# EAGLE design Big VU meter - REV 5 (EAGLE 8.2.1)
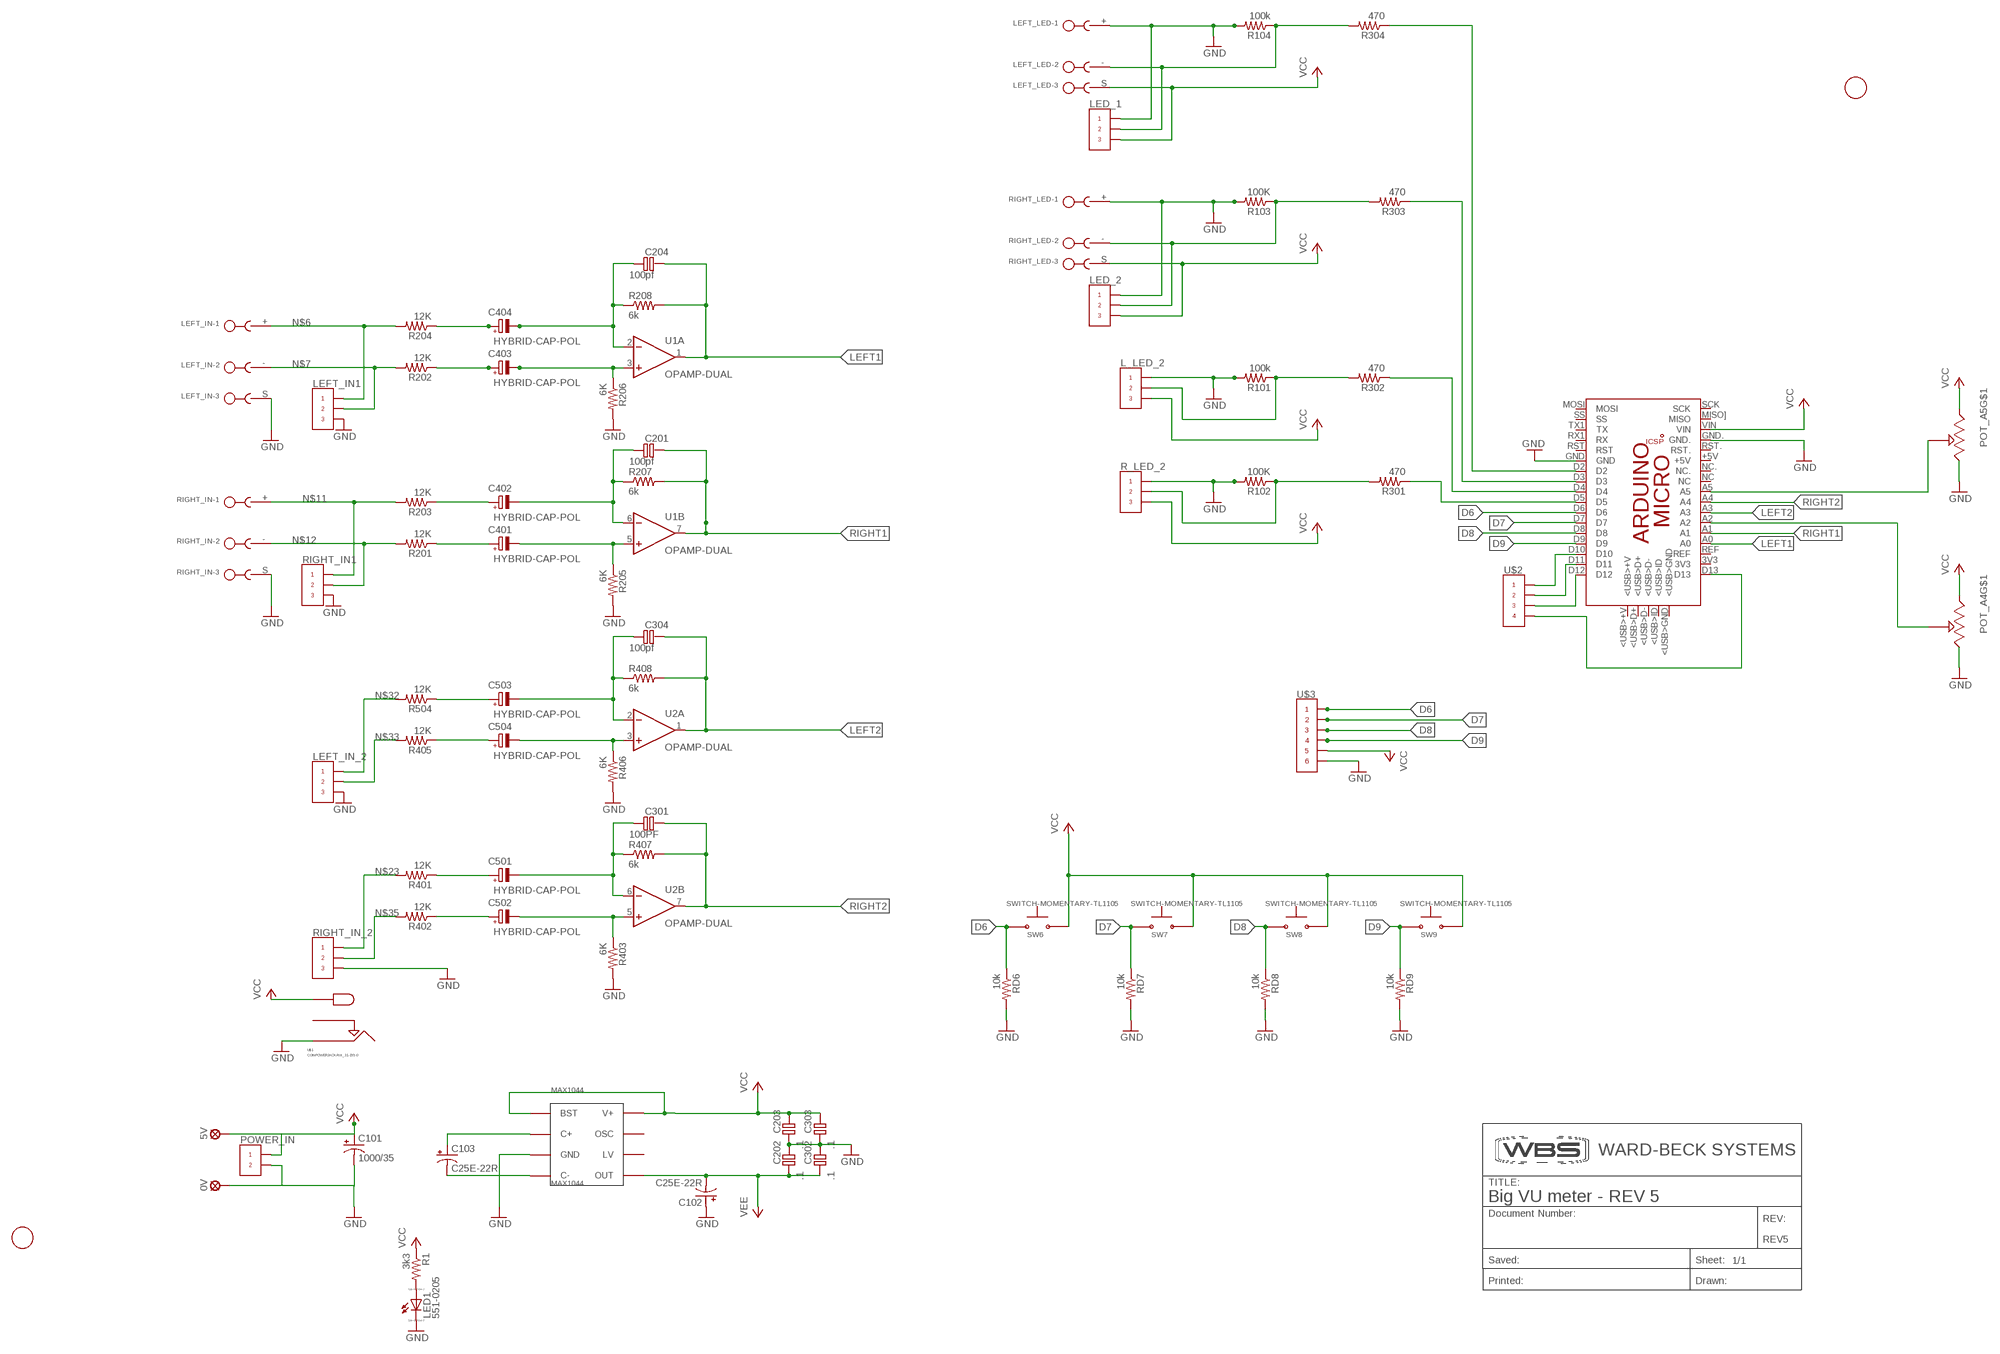
[diagram p0: schematic, sheet 1]

## Parts
0V  LSP13  [LSP13]
5V  LSP13  [LSP13]
C101  1000/35  CPOL-USE5-5  [E5-5]
C102  C25E-22R  CPOL-USE2.5-6  [E2,5-6]
C103  C25E-22R  CPOL-USE2.5-6  [E2,5-6]
C201  100pf  HYBRID-CERAMIC-1206-CAP  [HYBRID-CAP-CERAMIC-1206]
C202  .1  HYBRID-CERAMIC-1206-CAP  [HYBRID-CAP-CERAMIC-1206]
C203  .1  HYBRID-CERAMIC-1206-CAP  [HYBRID-CAP-CERAMIC-1206]
C204  100pf  HYBRID-CERAMIC-1206-CAP  [HYBRID-CAP-CERAMIC-1206]
C301  100PF  HYBRID-CERAMIC-1206-CAP  [HYBRID-CAP-CERAMIC-1206]
C302  .1  HYBRID-CERAMIC-1206-CAP  [HYBRID-CAP-CERAMIC-1206]
C303  .1  HYBRID-CERAMIC-1206-CAP  [HYBRID-CAP-CERAMIC-1206]
C304  100pf  HYBRID-CERAMIC-1206-CAP  [HYBRID-CAP-CERAMIC-1206]
C401  HYBRID-CAP-POL  [HYBRID-CAP-TANT]
C402  HYBRID-CAP-POL  [HYBRID-CAP-TANT]
C403  HYBRID-CAP-POL  [HYBRID-CAP-TANT]
C404  HYBRID-CAP-POL  [HYBRID-CAP-TANT]
C501  HYBRID-CAP-POL  [HYBRID-CAP-TANT]
C502  HYBRID-CAP-POL  [HYBRID-CAP-TANT]
C503  HYBRID-CAP-POL  [HYBRID-CAP-TANT]
C504  HYBRID-CAP-POL  [HYBRID-CAP-TANT]
L_LED_2  CON-WBS-LOCKING-0.1-3  [CON-WBS-LOCKING-0.1-3]
LED1  551-0205  LED_ELD260  [LED_LD260]
LED_1  CON-WBS-LOCKING-0.1-3  [CON-WBS-LOCKING-0.1-3]
LED_2  CON-WBS-LOCKING-0.1-3  [CON-WBS-LOCKING-0.1-3]
LEFT_IN  CON-PHOENIX_RIGHT_ANGLE_3.81  [CON-PHOENIX_MC1.5/3-G-3.81]
LEFT_IN1  CON-WBS-LOCKING-0.1-3  [CON-WBS-LOCKING-0.1-3]
LEFT_IN_2  CON-WBS-LOCKING-0.1-3  [CON-WBS-LOCKING-0.1-3]
LEFT_LED  CON-PHOENIX_RIGHT_ANGLE_3.81  [CON-PHOENIX_MC1.5/3-G-3.81]
MAX1044  MAX1044  [DIP8]
PCB1  ARDUINO_MICRO  [ARDUINO_MICRO]
POT_A4  10-080  WBS_10-079_POT  [WBS_079]
POT_A5  10-080  WBS_10-079_POT  [WBS_079]
POWER_IN  CON-WBS-LOCKING-0.1-2  [CON-WBS-LOCKING-0.1-2]
R1  3k3  HYBRID-RESITOR-1206-0.3  [HYBRID-RESISTOR-1206-0.3]
R101  100k  HYBRID-RESITOR-1206-0.3  [HYBRID-RESISTOR-1206-0.3]
R102  100K  HYBRID-RESITOR-1206-0.3  [HYBRID-RESISTOR-1206-0.3]
R103  100K  HYBRID-RESITOR-1206-0.3  [HYBRID-RESISTOR-1206-0.3]
R104  100k  HYBRID-RESITOR-1206-0.3  [HYBRID-RESISTOR-1206-0.3]
R201  12K  HYBRID-RESITOR-1206-0.3  [HYBRID-RESISTOR-1206-0.3]
R202  12K  HYBRID-RESITOR-1206-0.3  [HYBRID-RESISTOR-1206-0.3]
R203  12K  HYBRID-RESITOR-1206-0.3  [HYBRID-RESISTOR-1206-0.3]
R204  12K  HYBRID-RESITOR-1206-0.3  [HYBRID-RESISTOR-1206-0.3]
R205  6K  HYBRID-RESITOR-1206-0.3  [HYBRID-RESISTOR-1206-0.3]
R206  6K  HYBRID-RESITOR-1206-0.3  [HYBRID-RESISTOR-1206-0.3]
R207  6k  HYBRID-RESITOR-1206-0.3  [HYBRID-RESISTOR-1206-0.3]
R208  6k  HYBRID-RESITOR-1206-0.3  [HYBRID-RESISTOR-1206-0.3]
R301  470  HYBRID-RESITOR-1206-0.3  [HYBRID-RESISTOR-1206-0.3]
R302  470  HYBRID-RESITOR-1206-0.3  [HYBRID-RESISTOR-1206-0.3]
R303  470  HYBRID-RESITOR-1206-0.3  [HYBRID-RESISTOR-1206-0.3]
R304  470  HYBRID-RESITOR-1206-0.3  [HYBRID-RESISTOR-1206-0.3]
R401  12K  HYBRID-RESITOR-1206-0.3  [HYBRID-RESISTOR-1206-0.3]
R402  12K  HYBRID-RESITOR-1206-0.3  [HYBRID-RESISTOR-1206-0.3]
R403  6K  HYBRID-RESITOR-1206-0.3  [HYBRID-RESISTOR-1206-0.3]
R405  12K  HYBRID-RESITOR-1206-0.3  [HYBRID-RESISTOR-1206-0.3]
R406  6K  HYBRID-RESITOR-1206-0.3  [HYBRID-RESISTOR-1206-0.3]
R407  6k  HYBRID-RESITOR-1206-0.3  [HYBRID-RESISTOR-1206-0.3]
R408  6k  HYBRID-RESITOR-1206-0.3  [HYBRID-RESISTOR-1206-0.3]
R504  12K  HYBRID-RESITOR-1206-0.3  [HYBRID-RESISTOR-1206-0.3]
R_LED_2  CON-WBS-LOCKING-0.1-3  [CON-WBS-LOCKING-0.1-3]
RD6  10k  HYBRID-RESITOR-1206-0.3  [HYBRID-RESISTOR-1206-0.3]
RD7  10k  HYBRID-RESITOR-1206-0.3  [HYBRID-RESISTOR-1206-0.3]
RD8  10k  HYBRID-RESITOR-1206-0.3  [HYBRID-RESISTOR-1206-0.3]
RD9  10k  HYBRID-RESITOR-1206-0.3  [HYBRID-RESISTOR-1206-0.3]
REV5  WBS-DOCUMENT_INFO_FRAME  [WBS-FRAME_PCB]
RIGHT_IN  CON-PHOENIX_RIGHT_ANGLE_3.81  [CON-PHOENIX_MC1.5/3-G-3.81]
RIGHT_IN1  CON-WBS-LOCKING-0.1-3  [CON-WBS-LOCKING-0.1-3]
RIGHT_IN_2  CON-WBS-LOCKING-0.1-3  [CON-WBS-LOCKING-0.1-3]
RIGHT_LED  CON-PHOENIX_RIGHT_ANGLE_3.81  [CON-PHOENIX_MC1.5/3-G-3.81]
SW6  SWITCH-MOMENTARY-TL1105  [SWITCH-TACT_TL1105]
SW7  SWITCH-MOMENTARY-TL1105  [SWITCH-TACT_TL1105]
SW8  SWITCH-MOMENTARY-TL1105  [SWITCH-TACT_TL1105]
SW9  SWITCH-MOMENTARY-TL1105  [SWITCH-TACT_TL1105]
U1  OPAMP-DUAL  [DIP8]
U2  OPAMP-DUAL  [DIP8]
U$1  CON-POWERJACK-R/A_31-155-0  [CON-POWERJACK-R/A_31-155-0]
U$2  CON-WBS-LOCKING-0.1-4  [CON-WBS-LOCKING-0.1-4]
U$3  CON-WBS-LOCKING-0.1-6  [CON-WBS-LOCKING-0.1-6]
U$4  FIDUCIAL  [FIDUCIAL_1MM]
U$5  FIDUCIAL  [FIDUCIAL_1MM]

## Nets
D6: PCB1.D6 RD6.1 RD6.1A SW6.P$1 SW6.P$2 U$3.P$1
D7: PCB1.D7 RD7.1 RD7.1A SW7.P$1 SW7.P$2 U$3.P$2
D8: PCB1.D8 RD8.1 RD8.1A SW8.P$1 SW8.P$2 U$3.P$3
D9: PCB1.D9 RD9.1 RD9.1A SW9.P$1 SW9.P$2 U$3.P$4
D10: PCB1.D10 U$2.P$1
D11: PCB1.D11 U$2.P$2
D12: PCB1.D12 U$2.P$3
D13: PCB1.D13 U$2.P$4
GND: 0V.MP C101.- C102.+ C202.2(-) C202.B2(-) C203.1(+) C203.A1(+) C302.2(-) C302.B2(-) C303.1(+) C303.A1(+) L_LED_2.P$1 LED1.K(C) LED_1.P$1 LED_2.P$1 LEFT_IN1.P$3 LEFT_IN.S LEFT_IN_2.P$3 LEFT_LED.+ MAX1044.P$3(GND) PCB1.GND PCB1.GND. POT_A4.P$3(CW) POT_A5.P$3(CW) POWER_IN.P$2 R101.2 R101.2A R102.2 R102.2A R103.2 R103.2A R104.2 R104.2A R205.2 R205.2A R206.2 R206.2A R403.2 R403.2A R406.2 R406.2A R_LED_2.P$1 RD6.2 RD6.2A RD7.2 RD7.2A RD8.2 RD8.2A RD9.2 RD9.2A RIGHT_IN1.P$3 RIGHT_IN.S RIGHT_IN_2.P$3 RIGHT_LED.+ U$1.SLEEVE U$3.P$6
LEFT1: C204.2(-) C204.B2(-) PCB1.A0 R208.2 R208.2A U1.1(A:OUT)
LEFT2: C304.2(-) C304.B2(-) PCB1.A3 R408.2 R408.2A U2.1(A:OUT)
N$1 [POWER]: C103.+ MAX1044.P$2(C+)
N$2 [POWER]: C103.- MAX1044.P$4(C-)
N$3: C204.1(+) C204.A1(+) C404.- C404.-VE(-) R208.1 R208.1A U1.2(A:IN-)
N$4: C403.- C403.-VE(-) R206.1 R206.1A U1.3(A:IN+)
N$5: PCB1.A5 POT_A5.P$2(WIPER)
N$6: LEFT_IN1.P$1 LEFT_IN.+ R204.2 R204.2A
N$7: LEFT_IN1.P$2 LEFT_IN.- R202.2 R202.2A
N$8: C201.1(+) C201.A1(+) C402.- C402.-VE(-) R207.1 R207.1A U1.6(B:IN-)
N$9: C401.- C401.-VE(-) R205.1 R205.1A U1.5(B:IN+)
N$10: PCB1.D3 R303.1 R303.1A
N$11: R203.2 R203.2A RIGHT_IN1.P$1 RIGHT_IN.+
N$12: R201.2 R201.2A RIGHT_IN1.P$2 RIGHT_IN.-
N$13: PCB1.D2 R304.1 R304.1A
N$14 [POWER]: LED_2.P$2 R103.1 R103.1A R303.2 R303.2A RIGHT_LED.-
N$15 [POWER]: LED_1.P$2 LEFT_LED.- R104.1 R104.1A R304.2 R304.2A
N$16: PCB1.A2 POT_A4.P$2(WIPER)
N$17: C304.1(+) C304.A1(+) C503.- C503.-VE(-) R408.1 R408.1A U2.2(A:IN-)
N$18: C504.- C504.-VE(-) R406.1 R406.1A U2.3(A:IN+)
N$19: LED1.A R1.2 R1.2A
N$20: R102.1 R102.1A R301.2 R301.2A R_LED_2.P$2
N$21: C301.1(+) C301.A1(+) C501.- C501.-VE(-) R407.1 R407.1A U2.6(B:IN-)
N$22: C502.- C502.-VE(-) R403.1 R403.1A U2.5(B:IN+)
N$23: R401.2 R401.2A RIGHT_IN_2.P$1
N$24: L_LED_2.P$2 R101.1 R101.1A R302.2 R302.2A
N$25: PCB1.D4 R302.1 R302.1A
N$26: PCB1.D5 R301.1 R301.1A
N$27: C501.+ C501.+VE(+) R401.1 R401.1A
N$28: C502.+ C502.+VE(+) R402.1 R402.1A
N$29: C503.+ C503.+VE(+) R504.1 R504.1A
N$30: C504.+ C504.+VE(+) R405.1 R405.1A
N$31: C401.+ C401.+VE(+) R201.1 R201.1A
N$32: LEFT_IN_2.P$1 R504.2 R504.2A
N$33: LEFT_IN_2.P$2 R405.2 R405.2A
N$34: C402.+ C402.+VE(+) R203.1 R203.1A
N$35: R402.2 R402.2A RIGHT_IN_2.P$2
N$36: C404.+ C404.+VE(+) R204.1 R204.1A
N$37: C403.+ C403.+VE(+) R202.1 R202.1A
RIGHT1: C201.2(-) C201.B2(-) PCB1.A1 R207.2 R207.2A U1.7(B:OUT)
RIGHT2: C301.2(-) C301.B2(-) PCB1.A4 R407.2 R407.2A U2.7(B:OUT)
VCC [POWER]: 5V.MP C101.+ C203.2(-) C203.B2(-) C303.2(-) C303.B2(-) L_LED_2.P$3 LED_1.P$3 LED_2.P$3 LEFT_LED.S MAX1044.P$1(BST) MAX1044.P$8(V+) PCB1.VIN POT_A4.P$1(CCW) POT_A5.P$1(CCW) POWER_IN.P$1 R1.1 R1.1A R_LED_2.P$3 RIGHT_LED.S SW6.P$3 SW6.P$4 SW7.P$3 SW7.P$4 SW8.P$3 SW8.P$4 SW9.P$3 SW9.P$4 U$1.TIP U$3.P$5
VEE [POWER]: C102.- C202.1(+) C202.A1(+) C302.1(+) C302.A1(+) MAX1044.P$5(OUT)
Unconnected: MAX1044.P$6(LV) MAX1044.P$7(OSC) PCB1.3V3 PCB1.5V PCB1.+5V PCB1.<USB>+V PCB1.<USB>D+ PCB1.<USB>D- PCB1.<USB>GND PCB1.<USB>ID PCB1.GND_ PCB1.MISO. PCB1.MISO](MISO) PCB1.MOSI PCB1.MOSI. PCB1.NC PCB1.NC. PCB1.REF PCB1.RESET.. PCB1.RST PCB1.RST. PCB1.RX1(RX) PCB1.SCK PCB1.SCK. PCB1.SS PCB1.TX1(TX) POT_A4.P$4(CCW) POT_A4.P$5(WIPER) POT_A4.P$6(CW) POT_A5.P$4(CCW) POT_A5.P$5(WIPER) POT_A5.P$6(CW) U$1.CONTACT(NORM)

## Power pins joined to a net without a drawn wire
VCC: U1.8(SUP:VCC) U2.8(SUP:VCC)
VEE: U1.4(SUP:VEE) U2.4(SUP:VEE)

## Library data of the parts
0V 5V = solpad:LSP13: SOLDER PAD drill 1.3 mm, distributor Buerklin, 12H562
C101-C103 = rcl:CPOL-US: POLARIZED CAPACITOR, American symbol
C201-C204 C301-C304 = APK - PARTS:HYBRID-CERAMIC-1206-CAP
C401-C404 C501-C504 = APK - PARTS:HYBRID-CAP-POL
L_LED_2 LED_1 LED_2 LEFT_IN1 LEFT_IN_2 R_LED_2 RIGHT_IN1 RIGHT_IN_2 = APK - PARTS:CON-WBS-LOCKING-0.1-3
LED1 = eagle-ltspice:LED_E: LED Source: http://www.osram.convergy.de Source: www.luxeon.com Source: www.kingbright.com; SPICEMODEL: NONE; SPICEPREFIX: D; SPICETYPE: diode
LEFT_IN LEFT_LED RIGHT_IN RIGHT_LED = APK - PARTS:CON-PHOENIX_RIGHT_ANGLE_3.81
MAX1044 = APK - PARTS:MAX1044
PCB1 = E14_Arduino_revB:ARDUINO_MICRO: Device for representing an Arduino Micro board with a footprint in an EAGLE design. Created by Dave Young for Element14. More EAGLE documentation at: http://www.element14.com/community/community/knode/cadsoft_eagle
POT_A4 POT_A5 = APK - PARTS:WBS_10-079_POT
POWER_IN = APK - PARTS:CON-WBS-LOCKING-0.1-2
R1 R101-R104 R201-R208 R301-R304 R401-R403 R405-R408 R504 RD6-RD9 = APK - PARTS:HYBRID-RESITOR-1206-0.3
REV5 = APK - PARTS:WBS-DOCUMENT_INFO_FRAME
SW6-SW9 = APK - PARTS:SWITCH-MOMENTARY-TL1105
U1 U2 = Op Amps:OPAMP-DUAL: Operational amplifier, dual; SPICE: X{NAME}A {A.IN+.NET} {A.IN-.NET} {VCC.NET} {VEE.NET} {A.OUT.NET} OPAMP\nX{NAME}B {B.IN+.NET} {B.IN-.NET} {VCC.NET} {VEE.NET} {B.OUT.NET} OPAMP; SPICEMOD: .SUBCKT OPAMP 1 2 101 102 81\n.model NPN NPN(BF=50000)\nQ1 5 1 7 NPN\nQ2 6 2 8 NPN\nRC1 101 5 95.49\nRC2 101 6 95.49\nRE1 7 4 43.79\nRE2 8 4 43.79\nI1 4 102 0.001\nG1 100 10 6 5 0.0104719\nRP1 10 100 9.549MEG\nCP1 10 100 0.0016667UF\nEOUT 80 100 10 100 1\nRO 80 81 100\nRREF1 101 103 100K\nRREF2 103 102 100K\nEREF 100 0 103 0 1\nR100 100 0 1MEG\n.ENDS
U$1 = APK - PARTS:CON-POWERJACK-R/A_31-155-0
U$2 = APK - PARTS:CON-WBS-LOCKING-0.1-4
U$3 = APK - PARTS:CON-WBS-LOCKING-0.1-6
U$4 U$5 = adafruit:FIDUCIAL: For use by pick and place machines to calibrate the vision/machine, 1mm By microbuilder.eu

## Net classes
0 default: width 0.305 mm
1 POWER: width 0.508 mm
2 UNBALANCED AUDIO: width 0.635 mm, drill 0.254 mm

## Board
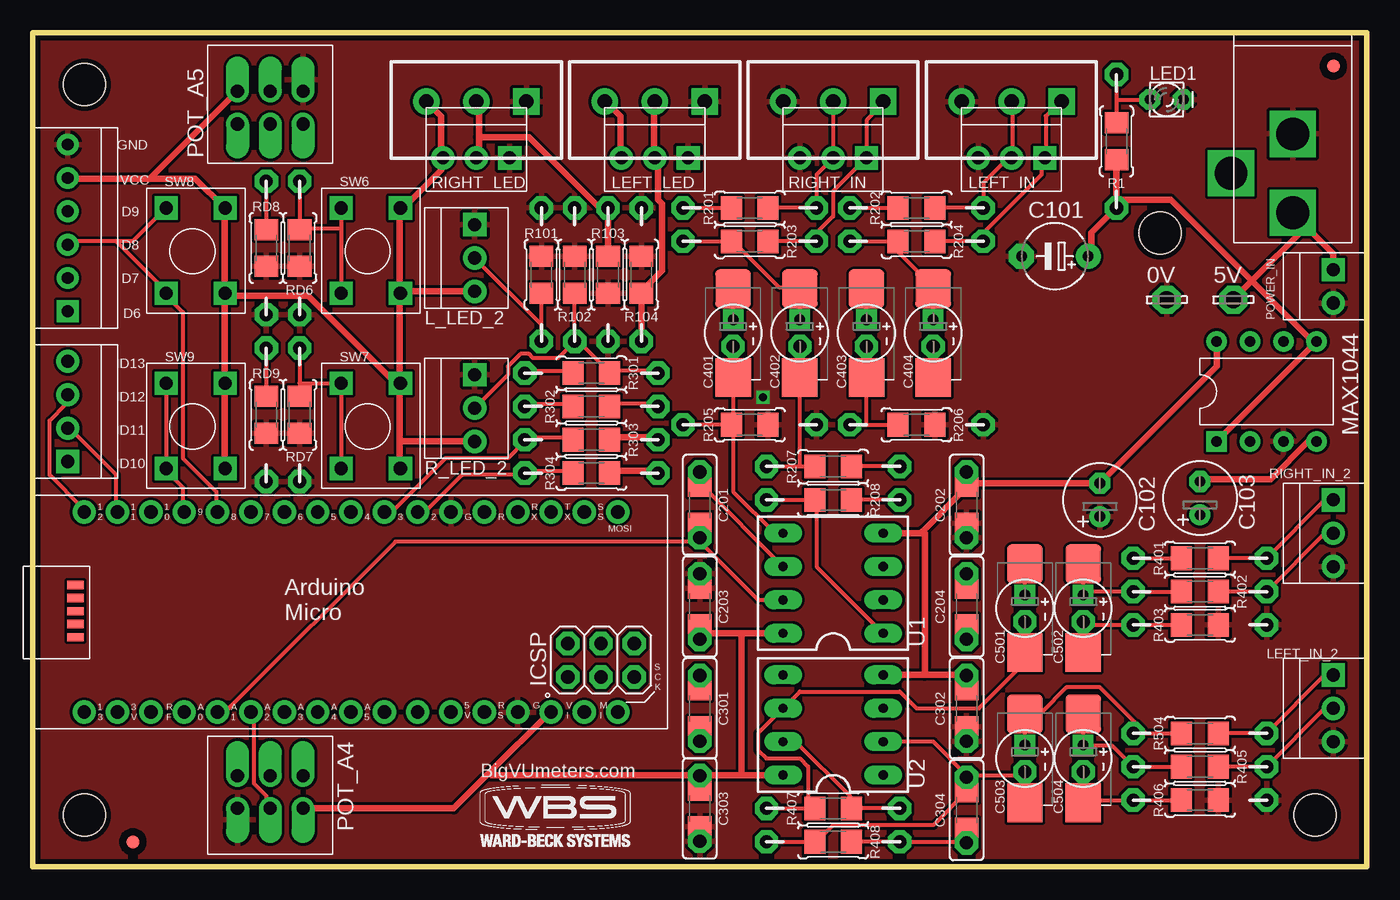
[diagram p1: board, top side]
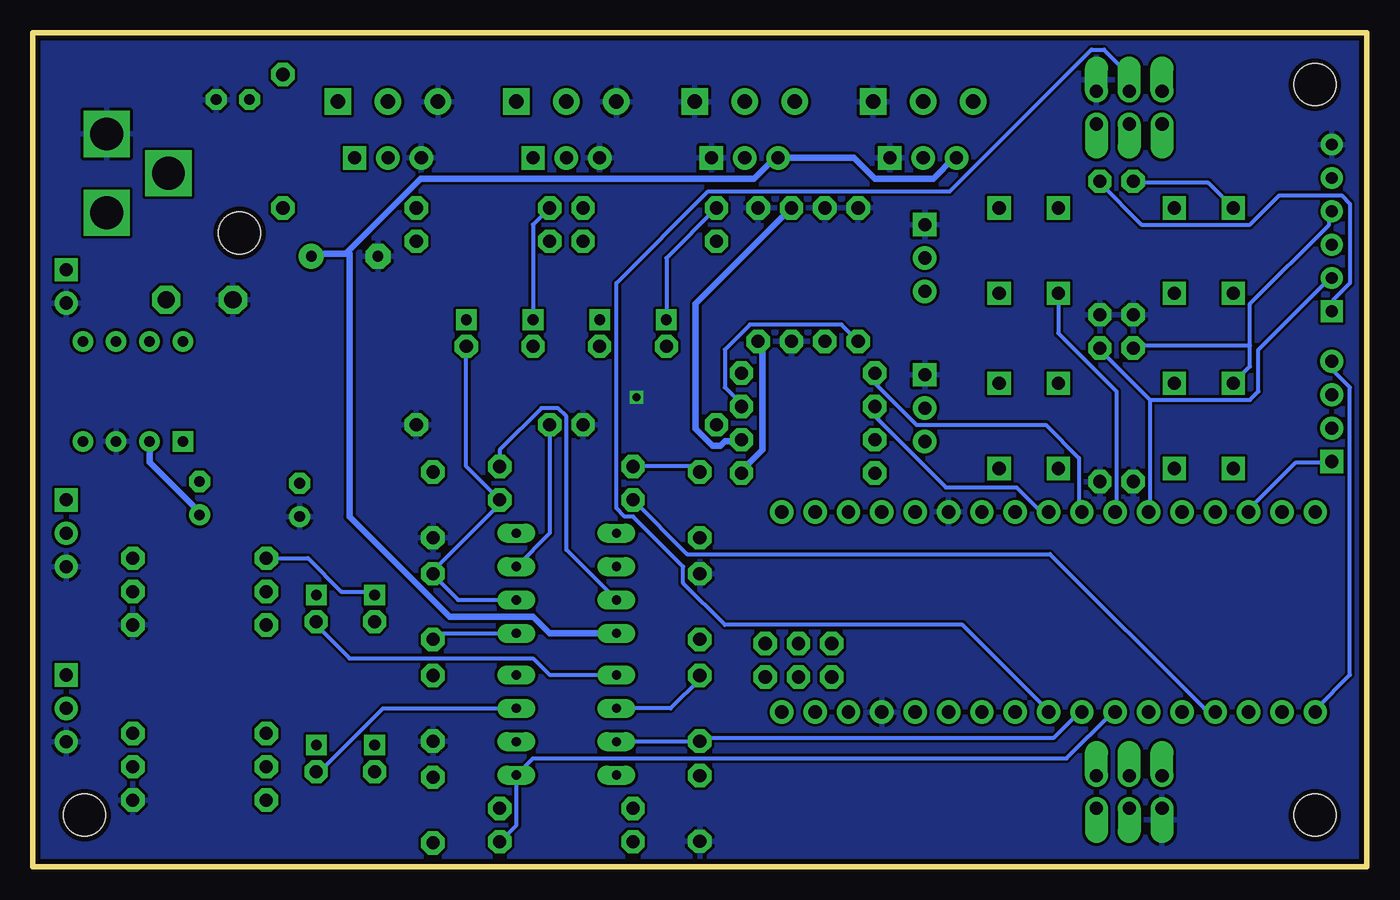
[diagram p2: board, bottom side, seen from below]

Size 101.6 x 63.5 mm. Coordinates in mm from the lower left corner, seen from the top.
Outline: 0,63.5 101.6,63.5 101.6,0 0,0 0,63.5
Copper layers (1*16): Top 0.035mm / dielectric 1.5mm / Bottom 0.035mm
Design rules "Starting Point *": minimum track width 10mil, minimum drill 24mil, track to track 8mil, track to pad 8mil, pad to pad 8mil, via to via 8mil, smd to smd 8mil, copper to edge 15mil, drill to drill 8mil, minimum pad ring 15mil, minimum via ring 8mil, stop-mask expansion 4mil, vias tented up to drill 0mil, thermal gap 10mil
Holes 3.2 mm at 3.94,59.56 3.94,3.94 97.66,3.94 85.85,48.26

### Footprints (pad centres in the part's own frame; a part is rotated, then mirrored left to right if it is on the bottom)
LSP13 = drill 1.321 pad 2.159 octagon: MP 0,0
E5-5 = drill 0.813 pad 1.905: + -2.54,0 | drill 0.813 pad 1.905 octagon: - 2.54,0
E2,5-6 = drill 0.813 pad 1.6: + -1.27,0 | drill 0.813 pad 1.6 octagon: - 1.27,0
HYBRID-CAP-CERAMIC-1206 = smd 1.6 x 1.8: 1 -1.4,0; 2 1.4,0 | drill 1 pad 1.778 octagon: A1 -2.5,0; B2 2.5,0
HYBRID-CAP-TANT = smd 2.95 x 2.7: + 3.375,0; - -3.375,0 | drill 0.813 pad 1.524 square: +VE 1.016,0 | drill 1 pad 1.524 octagon: -VE -1.016,0
CON-WBS-LOCKING-0.1-3 = drill 1 pad 1.778 square: P$1 2.54,0 | drill 1 pad 1.778: P$2 0,0; P$3 -2.54,0
LED_LD260 = drill 0.813 octagon: A -1.27,0; K 1.27,0
CON-PHOENIX_MC1.5/3-G-3.81 = drill 1.1 pad 2.032 square: + 3.81,0 | drill 1.1 pad 2.032: - 0,0; S -3.81,0
DIP8 = drill 0.8 square: P$1 -3.81,3.81 | drill 0.8: P$2 -3.81,1.27; P$3 -3.81,-1.27; P$4 -3.81,-3.81; P$5 3.81,3.81; P$6 3.81,1.27; P$7 3.81,-1.27; P$8 3.81,-3.81
ARDUINO_MICRO = drill 1.016 pad 1.575: 3V3 6.35,1.27; +5V 31.75,1.27; A0 11.43,1.27; A1 13.97,1.27; A2 16.51,1.27; A3 19.05,1.27; A4 21.59,1.27; A5 24.13,1.27; D2 29.21,16.51; D3 26.67,16.51; D4 24.13,16.51; D5 21.59,16.51; D6 19.05,16.51; D7 16.51,16.51; D8 13.97,16.51; D9 11.43,16.51; D10 8.89,16.51; D11 6.35,16.51; D12 3.81,16.51; D13 3.81,1.27; GND 31.75,16.51; GND. 36.83,1.27; MISO] 41.91,1.27; MOSI 44.45,16.51; NC 26.67,1.27; NC. 29.21,1.27; REF 8.89,1.27; RST 34.29,16.51; RST. 34.29,1.27; RX1 36.83,16.51; SCK 44.45,1.27; SS 41.91,16.51; TX1 39.37,16.51; VIN 39.37,1.27 | drill 1.016 pad 1.575 octagon: 5V 40.64,6.477; GND_ 45.72,6.477; MISO. 40.64,3.937; MOSI. 43.18,6.477; RESET.. 45.72,3.937; SCK. 43.18,3.937 | smd 1.27 x 0.635: <USB>+V 3.15,10.947; <USB>D+ 3.15,9.957; <USB>D- 3.15,8.941; <USB>GND 3.15,6.96; <USB>ID 3.15,7.976
WBS_079 = drill 1 offset: P$1 0,2.5; P$2 0,0; P$3 0,-2.5; P$4 -2.5,2.5; P$5 -2.5,0; P$6 -2.5,-2.5
CON-WBS-LOCKING-0.1-2 = drill 1 square: P$1 2.54,0 | drill 1: P$2 0,0
HYBRID-RESISTOR-1206-0.3 = smd 1.6 x 1.8: 1 -1.4,0; 2 1.4,0 | drill 1 pad 1.778 octagon: 1A -5.08,0; 2A 5.08,0
SWITCH-TACT_TL1105 = drill 1 square: P$1 -3.175,-1.905; P$2 3.325,-1.905; P$3 -3.175,2.595; P$4 3.325,2.595
DIP8' = drill 0.7 long: 1 0,2.54; 2 0,0; 3 0,-2.54; 4 0,-5.08; 5 7.62,-5.08; 6 7.62,-2.54; 7 7.62,0; 8 7.62,2.54
CON-POWERJACK-R/A_31-155-0 = drill 2.5 square: CONTACT 10.7,-4.7; SLEEVE 7.7,0; TIP 13.7,0
CON-WBS-LOCKING-0.1-4 = drill 1 square: P$1 5.08,0 | drill 1: P$2 2.54,0; P$3 0,0; P$4 -2.54,0
CON-WBS-LOCKING-0.1-6 = drill 0.9 square: P$1 6.35,0 | drill 0.9: P$2 3.81,0; P$3 1.27,0; P$4 -1.27,0; P$5 -3.81,0; P$6 -6.35,0
FIDUCIAL_1MM = smd 1 x 1: 1 0,0

### Placement (x,y rotation side)
0V  86.36,43.18 0 top
5V  91.44,43.18 0 top
C101  77.85,46.48 180 top
C102  81.28,27.94 90 top
C103  88.9,28.07 90 top
C201  50.8,27.56 270 top
C202  71.12,27.56 270 top
C203  50.8,19.81 270 top
C204  71.12,19.81 270 top
C301  50.8,12.06 270 top
C302  71.12,12.06 270 top
C303  50.8,4.45 90 top
C304  71.12,4.32 270 top
C401  53.34,40.64 90 top
C402  58.42,40.64 90 top
C403  63.5,40.64 90 top
C404  68.58,40.64 90 top
C501  75.56,19.69 90 top
C502  80.01,19.69 90 top
C503  75.56,8.26 90 top
C504  80.01,8.26 90 top
L_LED_2  33.66,46.36 90 top
LED1  86.36,58.42 0 top
LED_1  47.37,53.98 0 top
LED_2  33.78,53.98 0 top
LEFT_IN  74.55,58.27 0 top
LEFT_IN1  74.55,53.98 0 top
LEFT_IN_2  99.06,12.06 90 top
LEFT_LED  47.37,58.27 0 top
MAX1044  93.98,36.2 90 top
PCB1  0.1,10.52 0 top
POT_A4  18.08,4.45 270 top
POT_A5  18.08,59.05 90 top
POWER_IN  99.06,42.93 90 top
R1  82.55,55.24 90 top
R101  38.73,45.09 90 top
R102  41.27,45.09 90 top
R103  43.81,45.09 270 top
R104  46.35,45.09 90 top
R201  54.61,50.16 0 top
R202  67.31,50.16 0 top
R203  54.61,47.62 0 top
R204  67.31,47.62 0 top
R205  54.61,33.66 0 top
R206  67.31,33.66 0 top
R207  60.96,30.48 0 top
R208  60.96,27.94 180 top
R301  42.55,37.59 0 top
R302  42.55,35.05 0 top
R303  42.55,32.51 0 top
R304  42.55,29.97 0 top
R401  88.9,23.49 0 top
R402  88.9,20.95 0 top
R403  88.9,18.41 0 top
R405  88.9,7.62 0 top
R406  88.9,5.08 0 top
R407  60.96,4.45 0 top
R408  60.96,1.91 0 top
R504  88.9,10.16 0 top
R_LED_2  33.66,34.92 90 top
RD6  20.32,47.12 270 top
RD7  20.32,34.42 270 top
RD8  17.78,47.12 270 top
RD9  17.78,34.42 270 top
REV5  69.85,-52.07 0 top  (outside the outline)
RIGHT_IN  60.96,58.27 0 top
RIGHT_IN1  60.96,53.98 0 top
RIGHT_IN_2  99.06,25.4 90 top
RIGHT_LED  33.78,58.27 0 top
SW6  25.4,46.99 270 top
SW7  25.4,33.66 270 top
SW8  12.06,46.99 270 top
SW9  12.06,33.66 270 top
U1  OPAMP-DUAL  [DIP8']  64.77,20.32 180 top
U2  OPAMP-DUAL  [DIP8']  64.77,9.52 180 top
U$1  95.98,63.5 270 top
U$2  2.67,35.94 270 top
U$3  2.67,48.64 270 top
U$4  7.62,1.91 0 top
U$5  99.06,60.96 0 top

### Tracks (layer width: path | path; a pad name or v marks a point on that pad's centre or on a via)
D6
  Top 0.305: RD6.1A 20.32,48.58 | SW6.P$1 23.5,48.58 | 23.5,48.58 SW6.P$2 | 23.5,48.58 20.32,48.58 | 20.32,48.58 RD6.1
  Bottom 0.305: U$3.P$1 2.54,42.55 2.54,43.18 1.27,44.45 1.27,50.48 1.91,51.12 6.67,51.12 8.89,48.89 17.14,48.89 20.32,52.07 RD6.1A | SW6.P$2 23.5,40.64 19.05,36.2 19.05,27.3 PCB1.D6
D7
  Top 0.305: SW7.P$2 SW7.P$1 20.32,36.83 | RD7.1A 20.32,36.83 | 20.32,36.83 RD7.1
  Bottom 0.305: 16.51,35.56 8.89,35.56 8.26,36.2 8.26,39.37 2.86,44.77 U$3.P$2 | 16.51,35.56 20.32,39.37 RD7.1A | 16.51,35.56 16.51,27.3 PCB1.D7
D8
  Top 0.305: RD8.1A RD8.1 | 6.35,47.62 7.62,47.62 SW8.P$1 | 6.35,47.62 2.86,47.62 U$3.P$3 | 6.35,47.62 10.16,43.81 SW8.P$2 10.16,43.5 11.43,42.23 11.43,31.12 13.97,28.58 13.97,27.3 PCB1.D8
  Bottom 0.305: SW8.P$1 12.06,52.07 17.78,52.07 RD8.1A
D9
  Top 0.305: RD9.1A RD9.1 | SW9.P$1 SW9.P$2 10.16,30.16 11.43,28.89 11.43,27.3 PCB1.D9
  Bottom 0.305: 8.89,39.69 8.89,38.1 SW9.P$1 | 8.89,39.69 8.89,42.86 2.86,48.89 2.86,49.85 U$3.P$4 | 8.89,39.69 17.78,39.69 RD9.1A
D10
  Bottom 0.305: U$2.P$1 2.86,30.8 5.4,30.8 8.89,27.3 PCB1.D10
D11
  Top 0.305: U$2.P$2 2.86,33.34 6.35,29.84 6.35,27.3 PCB1.D11
D12
  Top 0.305: U$2.P$3 2.54,35.88 2.54,35.24 1.27,33.97 1.27,29.84 3.81,27.3 PCB1.D12
D13
  Bottom 0.305: U$2.P$4 2.54,38.42 2.54,37.78 1.27,36.51 1.27,14.6 3.81,12.06 PCB1.D13
GND  (via drill 0.6)
  Top 0.305: R102.2 41.27,46.67 41.08,46.68 | 39.05,46.36 R101.2
  Bottom 0.305: R102.2A 41.23,50.21 | 39.05,50.16 R101.2A
  other vias: 55.63,35.75
  pour Top: 0,63.5 101.6,63.5 101.6,0 0,0
  pour Bottom: 0,63.5 101.6,63.5 101.6,0 0,0
LEFT1
  Top 0.305: C204.B2 C204.2 | R208.2A R208.2 59.69,27.94 59.69,22.86 U1.1
  Bottom 0.305: U1.1 70.8,17.78 71.12,17.46 C204.B2 | R208.2A 51.75,23.81 24.13,23.81 12.38,12.06 11.75,12.06 PCB1.A0
LEFT2
  Top 0.305: 71.12,1.91 C304.2 | R408.2 R408.2A 71.12,1.91 | 71.12,1.91 C304.B2
  Bottom 0.305: R408.2A 64.77,3.17 U2.1 63.5,8.26 22.86,8.26 19.37,11.75 PCB1.A3
N$1
  Bottom 0.508: MAX1044.P$2 92.71,30.8 88.9,26.99 C103.+
N$2
  Top 0.508: MAX1044.P$4 97.16,32.39 94.3,29.53 88.9,29.53 C103.-
N$3
  Top 0.305: C204.A1 C204.1 | C404.-VE C404.- | R208.1A R208.1
  Bottom 0.305: U1.2 69.22,20.32 71.12,22.23 C204.A1 71.12,22.54 66.04,27.62 R208.1A 68.58,30.48 C404.-VE
N$4
  Top 0.305: C403.-VE C403.- 63.5,33.66 | R206.1A 63.5,33.66 | 63.5,33.66 R206.1
  Bottom 0.305: U1.3 62.23,25.4 R206.1A
N$5
  Bottom 0.305: POT_A5.P$2 18.1,59.05 18.1,60.33 20,62.23 20.95,62.23 31.75,51.44 50.16,51.44 57.15,44.45 57.15,27.3 56.52,26.67 55.88,26.67 52.07,22.86 52.07,21.59 48.9,18.41 30.8,18.41 24.45,12.06 PCB1.A5
N$6
  Top 0.305: R204.2 R204.2A 72.39,48.26 76.83,52.7 76.83,53.98 LEFT_IN1.P$1 77.15,53.98 77.15,57.15 78.11,58.1 LEFT_IN.+
N$7
  Top 0.305: R202.2 R202.2A 72.39,52.07 74.3,53.98 LEFT_IN1.P$2 74.61,53.98 74.61,58.1 LEFT_IN.-
N$8
  Top 0.305: C402.-VE C402.- 58.42,30.48 | R207.1A 58.42,30.48 | 58.42,30.48 R207.1 | 50.8,29.21 C201.A1 50.8,29.84 | 50.8,29.21 C201.1 | 50.8,29.21 U1.6
  Bottom 0.305: R207.1A 51.12,30.48 50.8,30.16 C201.A1
N$9
  Top 0.305: 53.34,33.66 C401.- C401.-VE | U1.5 56.52,25.4 53.34,28.58 53.34,33.66 | 53.34,33.66 R205.1 R205.1A
N$10
  Top 0.305: R303.1 40.96,32.7 37.47,32.7 R303.1A 37.47,32.39 36.2,31.12 31.43,31.12 27.62,27.3 26.99,27.3 PCB1.D3
N$11
  Top 0.305: R203.2 R203.2A 59.69,48.26 60.96,49.53 60.96,51.44 RIGHT_IN1.P$1 63.5,56.83 64.77,58.1 RIGHT_IN.+
N$12
  Top 0.305: R201.2 R201.2A 59.69,52.7 RIGHT_IN1.P$2 RIGHT_IN.-
N$13
  Top 0.305: R304.1 40.96,30.16 37.47,30.16 R304.1A 37.47,29.84 32.7,29.84 30.16,27.3 29.53,27.3 PCB1.D2
N$14
  Top 0.508: R303.2 44.13,32.7 47.62,32.7 R303.2A | R103.1 R103.1A 43.18,50.16 37.78,55.56 33.97,55.56 | 33.97,55.56 33.97,58.1 RIGHT_LED.- | 33.97,55.56 33.97,53.98 LED_2.P$2
  Bottom 0.508: R103.1A 51.12,42.86 51.12,33.34 49.85,32.07 49.21,32.07 48.9,32.39 47.62,32.39 R303.2A
N$15
  Top 0.508: LEFT_LED.- 47.31,58.1 47.31,53.98 LED_1.P$2 47.62,53.98 47.62,50.8 47.94,50.48 47.94,45.4 46.35,43.81 R104.1 R104.1A | R304.2 44.13,30.16 47.62,30.16 R304.2A
  Bottom 0.508: R104.1A 46.04,39.69 46.04,31.75 47.62,30.16 R304.2A
N$16
  Top 0.305: POT_A4.P$2 17.78,4.45 17.78,5.4 16.83,6.35 16.83,11.75 PCB1.A2
N$17
  Top 0.305: R408.1A R408.1 59.69,1.91 60.96,3.17 68.58,3.17 C304.1 C304.A1 71.12,6.98 | 75.56,6.98 C503.- | U2.2 68.58,9.52 71.12,6.98 | 71.12,6.98 75.56,6.98 | 75.56,6.98 C503.-VE
N$18
  Top 0.305: R406.1 R406.1A 80.01,5.08 | C504.-VE 80.01,5.08 | 80.01,5.08 C504.-
  Bottom 0.305: U2.3 74.93,12.06 80.01,6.98 C504.-VE
N$19
  Top 0.305: R1.2A 82.55,58.42 | 82.55,58.42 R1.2 | 82.55,58.42 LED1.A
N$20
  Top 0.305: R301.2A 47.62,37.78 44.13,37.78 R301.2 43.81,37.78 41.27,40.32 | 41.27,40.32 R102.1 | R_LED_2.P$2 36.2,37.47 36.2,38.1 37.15,39.05 37.78,39.05 38.1,38.73 40.01,38.73 R102.1A 41.27,40.32
N$21
  Top 0.305: R407.1A 59.05,4.45 | 59.05,4.45 R407.1 59.37,4.45 | C501.-VE C501.- 75.56,15.56 72.07,12.06 67.31,12.06 66.04,13.34 58.42,13.34 U2.6 55.24,10.16 55.24,8.89 55.88,8.26 58.42,8.26 59.05,7.62 59.05,4.45 | C301.A1 C301.1
  Bottom 0.305: U2.6 53.02,12.06 50.8,14.29 C301.A1
N$22
  Top 0.305: R403.1 R403.1A 80.01,18.41 | 80.01,18.41 C502.- | 80.01,18.41 C502.-VE
  Bottom 0.305: U2.5 62.23,14.6 63.5,15.88 77.47,15.88 80.01,18.41 C502.-VE
N$23
  Top 0.305: R401.2 R401.2A 98.42,27.94 RIGHT_IN_2.P$1
N$24
  Top 0.305: R302.2 44.13,35.24 47.62,35.24 R302.2A | R101.1A 38.73,41.27 | 38.73,41.27 R101.1 | 38.73,41.27 L_LED_2.P$2
  Bottom 0.305: R101.1A 40.01,41.27 46.99,41.27 48.9,39.37 48.9,36.51 47.62,35.24 R302.2A
N$25
  Top 0.305: R302.1 40.96,35.24 37.47,35.24 R302.1A
  Bottom 0.305: R302.1A 37.47,34.29 32.07,28.89 26.67,28.89 25.08,27.3 24.45,27.3 PCB1.D4
N$26
  Top 0.305: R301.1 40.96,37.78 37.47,37.78 R301.1A
  Bottom 0.305: R301.1A 37.47,36.83 34.29,33.66 24.45,33.66 21.91,31.12 21.91,27.3 PCB1.D5
N$27
  Top 0.305: C501.+VE C501.+ | R401.1A R401.1
  Bottom 0.305: R401.1A 80.64,23.49 78.11,20.95 75.56,20.95 C501.+VE
N$28
  Top 0.305: 80.01,20.95 C502.+ | R402.1 R402.1A 80.01,20.95 | 80.01,20.95 C502.+VE
N$29
  Top 0.305: C503.+VE C503.+ 75.56,11.75 76.83,11.75 78.74,13.65 81.28,13.65 84.77,10.16 | R504.1A 84.77,10.16 | 84.77,10.16 R504.1
N$30
  Top 0.305: C504.+ C504.+VE 80.01,9.21 82.23,9.21 R405.1A R405.1
N$31
  Top 0.305: C401.+VE C401.+ | R201.1A R201.1
  Bottom 0.305: C401.+VE 53.34,46.36 R201.1A
N$32
  Top 0.305: R504.2 R504.2A 98.42,14.6 LEFT_IN_2.P$1
N$33
  Top 0.305: R405.2 R405.2A 98.42,12.06 LEFT_IN_2.P$2
N$34
  Top 0.305: C402.+VE C402.+ 58.42,44.13 56.83,44.13 53.34,47.62 R203.1 R203.1A
N$35
  Top 0.305: R402.2 R402.2A 98.42,25.4 RIGHT_IN_2.P$2
N$36
  Top 0.305: C404.+VE C404.+ 68.58,44.13 65.09,47.62 | R204.1A 65.09,47.62 | 65.09,47.62 R204.1
N$37
  Top 0.305: C403.+VE C403.+ | R202.1A R202.1
  Bottom 0.305: C403.+VE 63.5,48.89 R202.1A
RIGHT1
  Top 0.305: R207.2A R207.2 | C201.2 C201.B2 50.8,24.77 | U1.7 55.24,20.32 50.8,24.77 | 50.8,24.77 27.62,24.77 14.92,12.06 14.29,12.06 PCB1.A1
  Bottom 0.305: R207.2A 66.04,31.75 62.87,34.92 61.59,34.92 60.96,34.29 60.96,24.13 U1.7
RIGHT2
  Top 0.305: R407.2A R407.2 62.23,4.45 62.23,5.4 58.1,9.52 U2.7 | C301.B2 C301.2
  Bottom 0.305: U2.7 50.8,9.52 C301.B2 50.8,9.84 23.81,9.84 21.91,11.75 PCB1.A4
VCC
  Top 0.508: C303.2 C303.B2 50.8,6.98 | 50.8,6.98 53.98,6.98 | 53.98,6.98 U2.8 | 50.8,17.78 C203.B2 50.8,17.46 | 50.8,17.78 C203.2 | 50.8,17.78 53.98,17.78 | 53.98,17.78 U1.8 | 53.98,17.78 53.98,6.98 | POT_A4.P$1 32.07,4.45 34.77,7.14 | 34.77,7.14 39.37,11.75 PCB1.VIN | 50.8,6.98 34.92,6.98 34.77,7.14 | 14.61,36.83 14.61,30.48 SW9.P$4 | 8.89,52.39 12.38,52.39 14.61,50.16 | 8.89,52.39 2.86,52.39 U$3.P$5 | 14.61,50.16 14.61,43.81 SW8.P$4 | 14.61,50.16 SW8.P$3 | 8.89,52.39 15.56,59.05 POT_A5.P$1 | 14.61,36.83 14.61,43.5 SW8.P$4 | 14.61,36.83 SW9.P$3 | MAX1044.P$1 MAX1044.P$8 97.47,40 92.87,44.61 | 82.55,50.8 R1.1 | C101.+ 80.64,46.67 80.64,48.26 R1.1A 82.55,50.8 | POWER_IN.P$1 99.06,46.67 96.2,49.53 U$1.TIP 96.84,48.58 92.87,44.61 | 92.87,44.61 5V.MP | 82.55,50.8 86.68,50.8 92.87,44.61 | 27.94,36.83 27.94,36.51 | 27.94,36.51 27.94,32.39 | 27.94,32.39 27.94,30.48 SW7.P$4 | 27.94,32.39 R_LED_2.P$3 | LED_1.P$3 44.77,53.98 44.77,57.15 43.81,58.1 LEFT_LED.S | 31.11,53.98 31.11,57.15 30.16,58.1 RIGHT_LED.S | L_LED_2.P$3 28.26,43.81 SW6.P$4 | SW6.P$4 27.94,43.81 27.94,50.16 SW6.P$3 28.26,50.16 31.11,53.02 31.11,53.98 | 31.11,53.98 LED_2.P$3 | 27.94,36.83 27.94,43.5 SW6.P$4 | 27.94,36.83 SW7.P$3 27.94,36.51 | 27.94,36.51 20.95,43.5 14.92,43.5 SW8.P$4
  Bottom 0.508: LED_2.P$3 31.43,53.98 33.02,52.39 37.47,52.39 39.05,53.98 LED_1.P$3 45.09,53.98 46.67,52.39 72.07,52.39 77.63,46.83 | 77.63,46.83 77.79,46.67 80.33,46.67 C101.+ | U1.8 62.23,17.78 63.5,19.05 69.85,19.05 77.47,26.67 77.47,46.67 77.63,46.83
VEE
  Top 0.508: MAX1044.P$5 90.17,38.1 C102.- 71.12,29.21 | C302.1 C302.A1 71.12,14.6 67.94,14.6 | 67.94,14.6 U2.4 | 71.12,29.21 C202.A1 71.12,29.84 | 71.12,29.21 C202.1 71.12,28.89 67.79,25.56 | U1.4 67.63,25.4 67.79,25.56 | 67.94,14.6 67.94,25.4 67.79,25.56

### Text on the board
tPlace: GND | VCC | D9 | D8 | D7 | D6 | D13 | D12 | D11 | D10 | BigVUmeters.com | /Users/anthonypeterkuzub/Google Drive/Ward-Beck Systems/BRAND ELEMENTS/WBS_Logo_PCB.bmp
tValues: BVU-SHIELD | REV 4